# Altium project Gateway-Device-v1.0.PrjPcb (part 3 of 3)
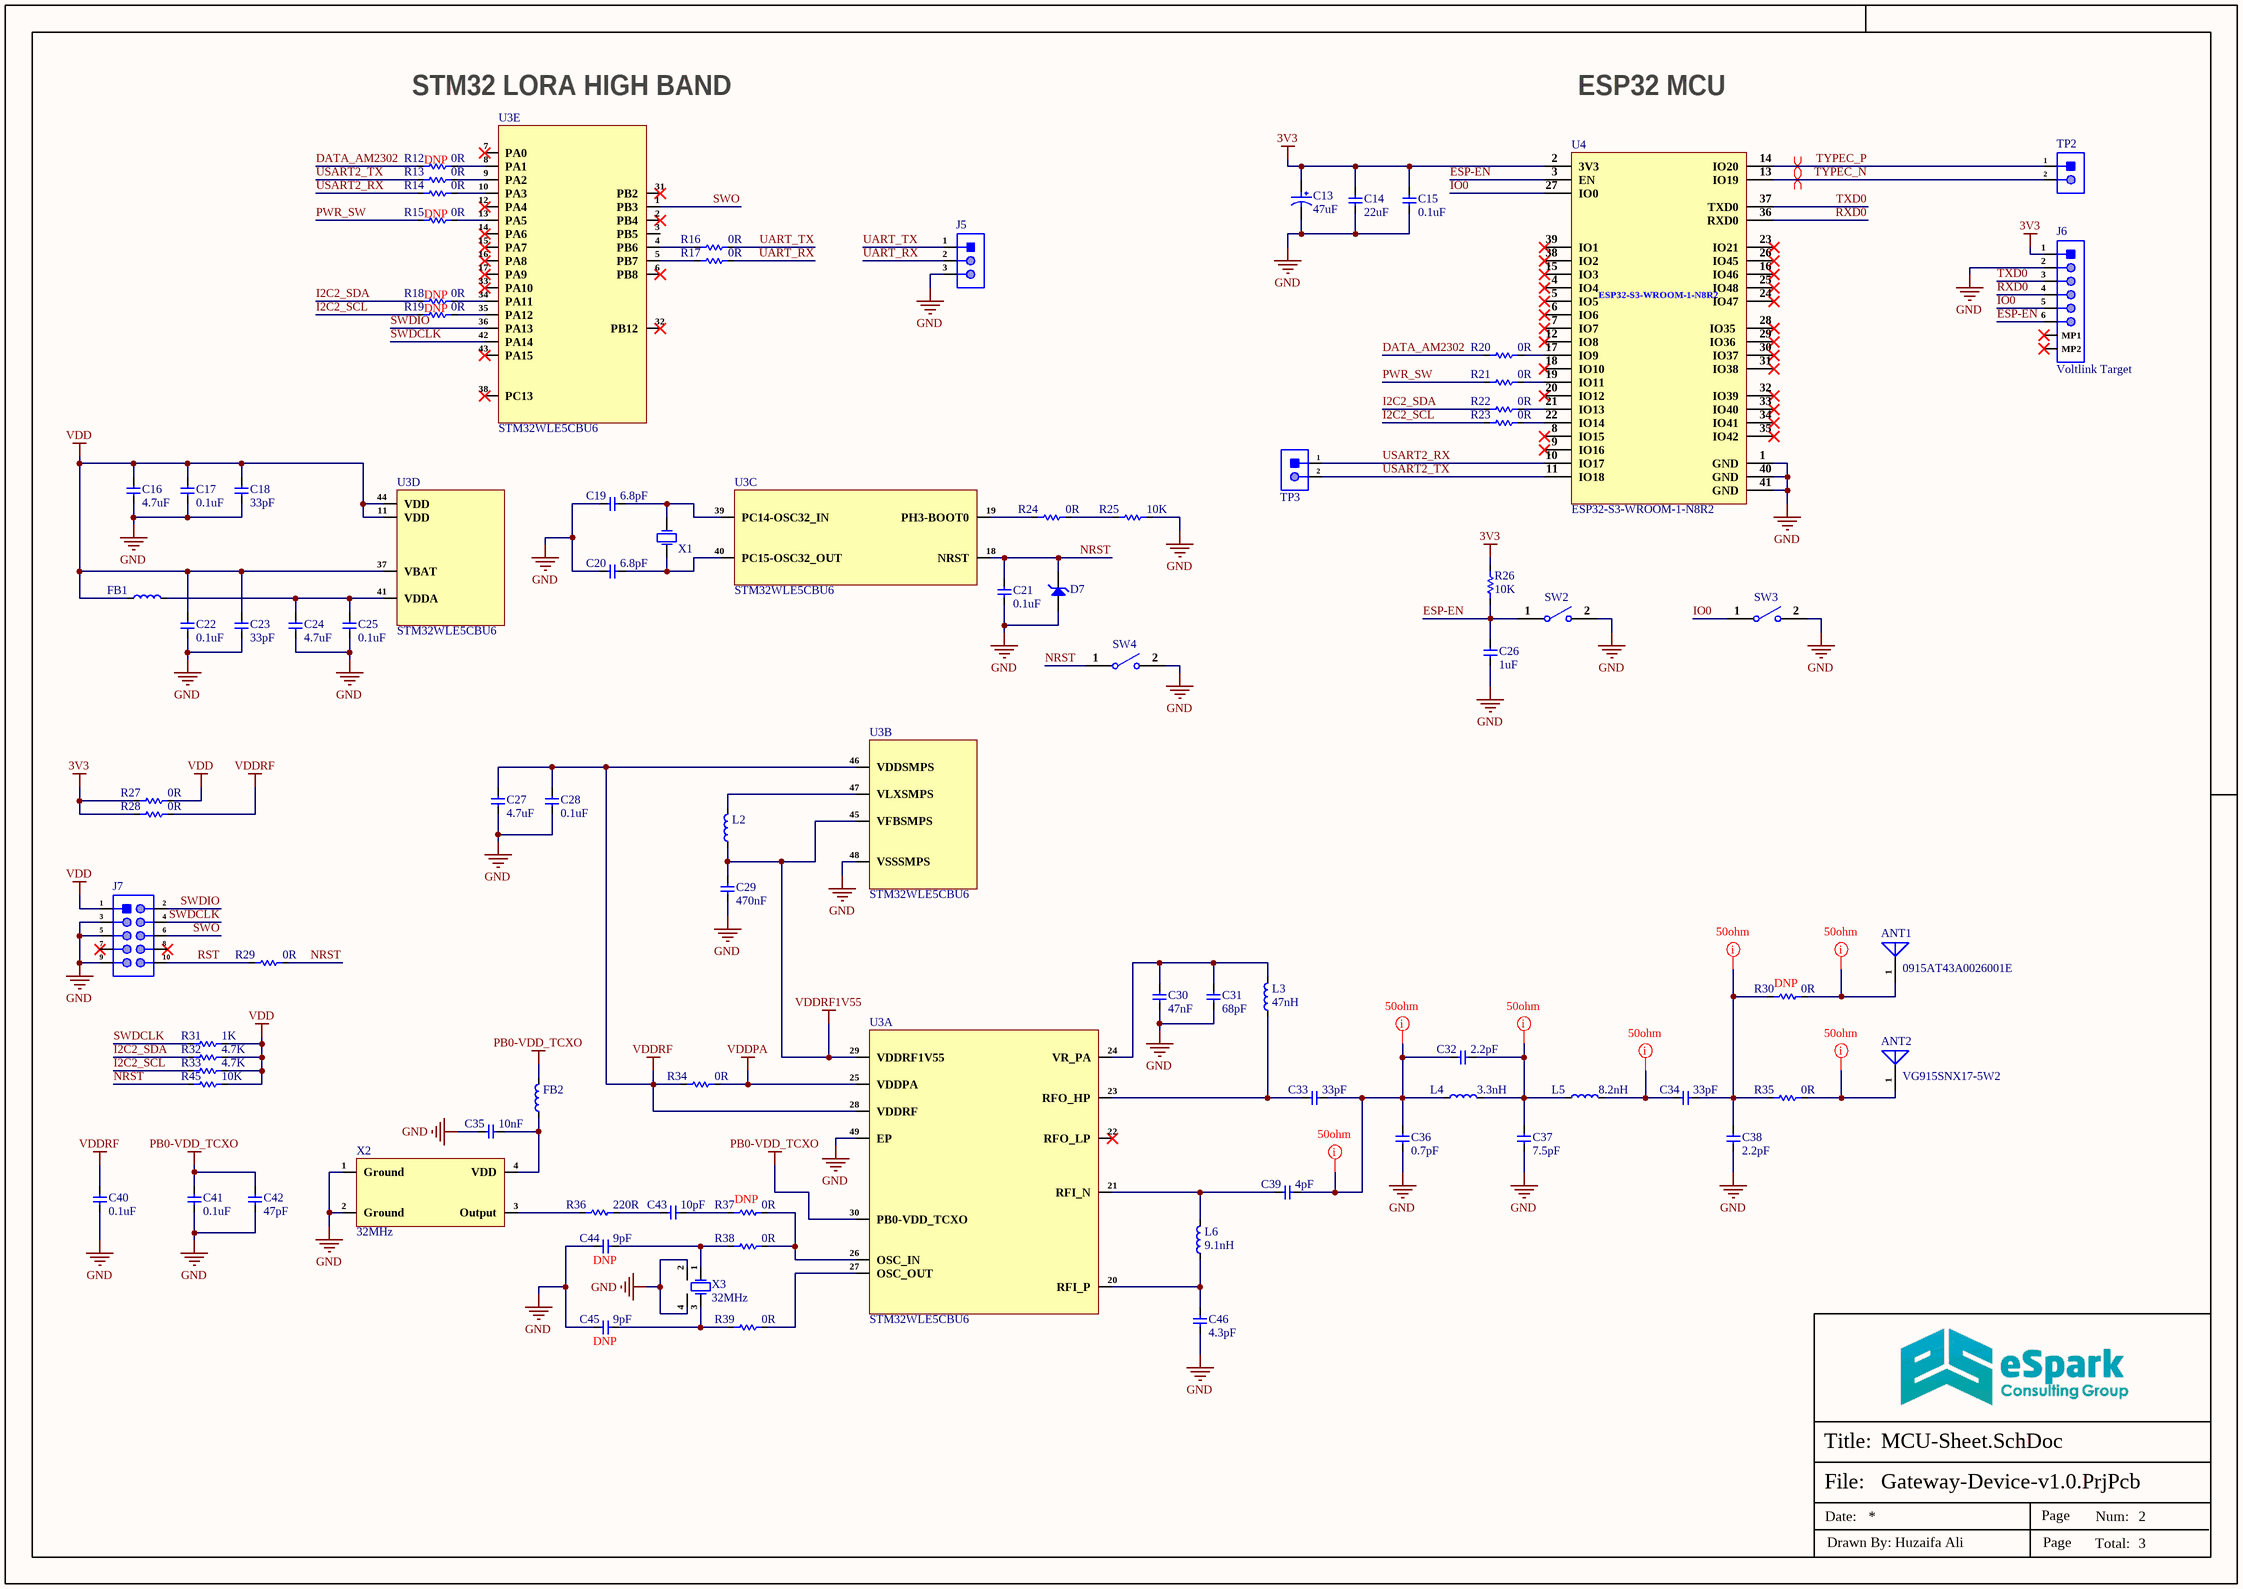
[diagram p4: MCU-Sheet.SchDoc]

## Sheet MCU-Sheet.SchDoc (continued)

### Library data of the parts (continued)
R27 R28 = RC0805FR-070RL: RES 0 OHM JUMPER 1/8W 0805; Manufacturer: Yageo; Resistance: 0mR; Tolerance: 1%; Power Rating: 125mW; Item Type: Resistor; Supplier 1: Avnet; Manufacturer Part Number: RC0805FR-070RL; RoHS: Yes; Category: Chip SMD Resistors; Stock 1: 85000; Pricing 1: 5000=0.00281, 10000=0.00277, 20000=0.00269 (USD); Case/Package: 0805; Contact Plating: Tin,Matte; Case Code (Imperial): 0805; Case Code (Metric): 2012; Size Code: 0805; Min Operating Temperature: -55°C; Max Operating Temperature: 155°C; Resistor Type: Thick Film; Packaging: Tape and Reel; Features: Moisture Resistant; Series: RC; Max Power Dissipation: 125mW; Number of Terminations: 2; Construction: Rectangular; Length: 2mm; Depth: 1.25mm; Radiation Hardening: No; Military Standard: Not; Lead Free: Lead Free; RoHS Compliant: Yes; ComponentLink1URL: https://datasheet.ciiva.com/15189/getdatasheetpartid-348154-15189885.pdf?src-supplier=Verical; ComponentLink1Description: https://datasheet.ciiva.com/15189/getdatasheetpartid-348154-15189885.pdf?src-supplier=Verical; ComponentLink2URL: https://datasheet.ciiva.com/17042/rc0805-17042698.pdf?src-supplier=Future+Electronics; ComponentLink2Description: https://datasheet.ciiva.com/17042/rc0805-17042698.pdf?src-supplier=Future+Electronics; Supplier Part Number 1: RC0805FR-070RL; LCSC Part Number: C100045
R31 = RC0201FR-071KP: RES 1K OHM 1% 1/20W 0201; Manufacturer: Yageo; Supplier 1: Digi-Key; Manufacturer Part Number: RC0201FR-071KP; RoHS: Yes; Stock 1: 4800; Pricing 1: 1=0.11000, 10=0.10200, 100=0.03940, 1000=0.01734, 2500=0.01497, 5000=0.01340 (USD); RoHS Compliant: Yes; Supplier Part Number 1: 13-RC0201FR-071KPCT-ND; LCSC Part Number: C3953443
R32 R33 = RC0402FR-074K7L: RES 4.7K OHM 1% 1/16W 0402; Manufacturer: Yageo; Voltage Rating (DC): 50V; Power Rating: 62.5mW; Resistance: 4.7kR; Temperature Coefficient: 100ppm/°C; Max Power Dissipation: 63mW; Item Type: Resistor; Supplier 1: Avnet; Manufacturer Part Number: RC0402FR-074K7L; RoHS: Yes; Category: Chip SMD Resistors; Stock 1: 2420000; Pricing 1: 10000=0.00085 (USD); Case/Package: 0402; Number of Pins: 2; Case Code (Imperial): 0402; Case Code (Metric): 1005; Size Code: 0402; Min Operating Temperature: -55°C; Max Operating Temperature: 155°C; Tolerance: 1%; Voltage Rating: 50V; Packaging: Tape and Reel; Resistor Type: Thick Film; Termination: SMD/SMT; Features: Moisture Resistant; Series: RC; Number of Terminations: 2; Resistance Tolerance: 1%; Construction: Rectangular; Length: 1mm; Width: 0.5mm; Height: 0.32mm; Depth: 0.5mm; Height - Seated (Max): 0.016inch; RoHS Compliant: Yes; Reach SVHC Compliant: Yes; Military Standard: Not; Lead Free: Lead Free; ComponentLink1URL: https://datasheet.ciiva.com/22661/1686128-22661342.pdf?src-supplier=Element14; ComponentLink1Description: https://datasheet.ciiva.com/22661/1686128-22661342.pdf?src-supplier=Element14; ComponentLink2URL: https://datasheet.ciiva.com/7850/1018594-7850022.pdf?src-supplier=Element14; ComponentLink2Description: https://datasheet.ciiva.com/7850/1018594-7850022.pdf?src-supplier=Element14; ComponentLink3URL: https://datasheet.ciiva.com/7850/1018594-7850023.pdf?src-supplier=Element14; ComponentLink3Description: https://datasheet.ciiva.com/7850/1018594-7850023.pdf?src-supplier=Element14; ComponentLink4URL: https://datasheet.ciiva.com/15215/getdatasheetpartid-328119-15215035.pdf?src-supplier=Verical; ComponentLink4Description: https://datasheet.ciiva.com/15215/getdatasheetpartid-328119-15215035.pdf?src-supplier=Verical; Supplier Part Number 1: RC0402FR-074K7L; LCSC Part Number: C105871
R36 = RC0402FR-07220RL: RES 220 OHM 1% 1/16W 0402; Manufacturer: Yageo; Item Type: Resistors; Power Rating: 62.5mW; Voltage Rating: 50V; Temperature Coefficient: 100ppm/°C; Max Power Dissipation: 63mW; Supplier: Digikey; LCSC Part Number: C112291; Manufacturer Part Number: RC0402FR-07220RL; RoHS: Yes; Stock: 225544; Pricing: 1=0.1, 10=0.007, 100=0.0061, 1000=0.0051, 2500=0.00408 (USD); Case/Package: 0402; Pins: 2; Case Code (Imperial): 0402; Case Code (Metric): 1005; Min Operating Temperature: -55°C; Max Operating Temperature: 155°C; Value: 220R; Tolerance: 1%; Packaging: Tape and Reel; Voltage Rating (DC): 50V; Package Quantity: 1; Termination: SMD/SMT; Resistor Type: Thick Film; Number of Terminations: 2; Features: Moisture Resistant; Series: RC; Resistance Tolerance: 1%; Construction: Rectangular; Technology: THICK FILM; Voltage Rating (AC): 50V; Length: 0.039inch; Width: 0.02inch; Height: 0.016inch; Depth: 0.5mm; Reach SVHC Compliant: No; Military Standard: Not; RoHS Compliant: Yes; Lead Free: 5697LeadFree; ComponentLink1URL: https://datasheet.ciiva.com/2453/pyu-r-int-thick-7-2453461.pdf?src-supplier=Digikey; ComponentLink1Description: https://datasheet.ciiva.com/2453/pyu-r-int-thick-7-2453461.pdf?src-supplier=Digikey
SW2-SW4 = B3U-1000P: SWITCH TACTILE SPST-NO 0.05A 12V; Manufacturer: Omron; Mechanical Life: 200000Cycles; Operating Force: 1.5N; Throw Configuration: SPST; Current Rating: 50mA; Contact Resistance: 100mR; Illumination Type: Non-Illuminated,Illuminated; Switch Travel: 0.15mm; Switch Function: Off-Mom; Actuator Type: Standard; Actuator Length: 0.4mm; Ratings: Dust Proof,IP40; ComponentLink1URL: http://www.farnell.com/datasheets/60838.pdf?src-supplier=Farnell; ComponentLink1Description: http://www.farnell.com/datasheets/60838.pdf?src-supplier=Farnell; ComponentLink2URL: http://www.farnell.com/datasheets/60838.pdf?src-supplier=Element14; ComponentLink2Description: http://www.farnell.com/datasheets/60838.pdf?src-supplier=Element14; ComponentLink3URL: https://omronfs.omron.com/en_US/ecb/products/pdf/en-b3u.pdf?src-supplier=Digi-Key; ComponentLink3Description: https://omronfs.omron.com/en_US/ecb/products/pdf/en-b3u.pdf?src-supplier=Digi-Key; ComponentLink4URL: http://www.omron.com/ecb/products/pdf/en-b3u.pdf?src-supplier=Digi-Key; ComponentLink4Description: http://www.omron.com/ecb/products/pdf/en-b3u.pdf?src-supplier=Digi-Key; ComponentLink5URL: https://www.distrelec.biz/Web/Downloads/he/et/B3U_eng_datasheet.pdf?mime=application%2Fpdf&src-supplier=Distrelec; ComponentLink5Description: https://www.distrelec.biz/Web/Downloads/he/et/B3U_eng_datasheet.pdf?mime=application%2Fpdf&src-supplier=Distrelec; ComponentLink6URL: http://www.onlinecomponents.com/productFiles/mf-OM/en-b3u.pdf?src-supplier=Onlinecomponents.com; ComponentLink6Description: http://www.onlinecomponents.com/productFiles/mf-OM/en-b3u.pdf?src-supplier=Onlinecomponents.com; Supplier 1: Digi-Key; Manufacturer Part Number: B3U-1000P; Stock 1: 116454; Pricing 1: 1=1, 10=0.961, 25=0.9064, 50=0.7976, 100=0.7251, 250=0.68888, 500=0.67074, 1000=0.52571 (USD); Mount: Surface Mount; Weight: 0.000776oz; Contact Material: Silver; Min Operating Temperature: -25°C; Max Operating Temperature: 70°C; Packaging: Tape and Reel; Voltage Rating (DC): 12V; Package Quantity: 1; Max Current Rating: 50mA; Termination: SMD/SMT; Orientation: Straight; Max Voltage Rating (DC): 12V; Electrical Life: 200000Cycles; Insulation Resistance: 100MR; Contact Current Rating: 50mA; Length: 4mm; Height: 1.2mm; Depth: 2.5mm; Width: 3mm; REACH SVHC: Unknown; Lead Free: Lead Free; ComponentLink7URL: https://www.verical.com/server-webapp/html/getDatasheet?partID=552554&src-supplier=Verical; ComponentLink7Description: https://www.verical.com/server-webapp/html/getDatasheet?partID=552554&src-supplier=Verical; ComponentLink8URL: http://www.farnell.com/datasheets/1685550.pdf?src-supplier=Element14; ComponentLink8Description: http://www.farnell.com/datasheets/1685550.pdf?src-supplier=Element14; ComponentLink9URL: http://www.farnell.com/datasheets/2610940.pdf?src-supplier=Farnell; ComponentLink9Description: http://www.farnell.com/datasheets/2610940.pdf?src-supplier=Farnell; ComponentLink10URL: https://www.alliedelec.com/m/d/4c8a9ef82804fc3c241a13c1e298fd73.pdf?src-supplier=Allied+Electronics; ComponentLink10Description: https://www.alliedelec.com/m/d/4c8a9ef82804fc3c241a13c1e298fd73.pdf?src-supplier=Allied+Electronics; Supplier Part Number 1: SW1020DKR-ND; LCSC Part Number: C231329; Item Type: Switch
TP2 TP3 = 2 Test Pad: Wire Connecting Pad; Item Type: Test Point; Manufacturer Part Number: 2 Test Pad
U3 = STM32WLE5CBU6: IC RF TXRX+MCU ISM<1GHZ 48UFQFPN; Manufacturer: STMicroelectronics; Core Architecture: 6081CoreArchitecture; Density: 128KB; Frequency: 48MHz; Max Supply Voltage: 3.6V; Min Supply Voltage: 1.8V; Nominal Supply Current: 31nA; Number of A/D Converters: 1NUMBER; Number of Channels: 12NUMBER; Number of I2C Channels: 3NUMBER; Number of I/Os: 29NUMBER; Number of SPI Channels: 2NUMBER; RAM Size: 48KB; Supplier: Arrow Electronics; LCSC Part Number: C1121847; Manufacturer Part Number: STM32WLE5CBU6; RoHS: No; Item Type: IC; Stock: 1358; Pricing: 1=3.071 (USD); Min Operating Temperature: -40°C; Max Operating Temperature: 85°C; Number of D/A Converters: 1NUMBER; Number of Timers/Counters: 1NUMBER; Number of UART Channels: 1NUMBER
U4 = ESP32-S3-WROOM-1-N8R2: SMD,18x25.5mm WiFi Modules ROHS; Manufacturer: Espressif Systems; Item Type: Module; Supplier 1: Digi-Key; Manufacturer Part Number: ESP32-S3-WROOM-1-N8R2; RoHS: No; Category: Uncategorized; Supplier Part Number 1: 1965-ESP32-S3-WROOM-1-N8R2-ND; ComponentLink1Description: LCSC; ComponentLink1URL: https://www.lcsc.com/product-detail/WiFi-Modules_Espressif-Systems-ESP32-S3-WROOM-1-N8R2_C2913204.html; LCSC Part Number: C2913204
X1 = NX3215SA-32.768K-STD-MUA-14: CRYSTAL 32.7680KHZ 6PF SMD; Manufacturer: NDK; Frequency: 32.768kHz; Frequency Tolerance: 20ppm; ESR (Equivalent Series Resistance): 70kR; Supplier 1: Rs; Manufacturer Part Number: NX3215SA-32.768K-STD-MUA-14; RoHS: Yes; Category: Crystals; Stock 1: 500; Pricing 1: 5=0.15520, 50=0.68600, 100=0.66600, 250=0.65000, 500=0.63400 (GBP); Mounting Technology: Surface Mount; Case/Package: SMD/SMT; Min Operating Temperature: -40°C; Max Operating Temperature: 85°C; Packaging: Cut Tape; Load Capacitance: 6pF; Series: NX3215SA; RoHS Compliant: Yes; ComponentLink1URL: https://datasheet.ciiva.com/6733/c-nx3215sa-std-mua-9-e-6733110.pdf?src-supplier=Digi-Key; ComponentLink1Description: https://datasheet.ciiva.com/6733/c-nx3215sa-std-mua-9-e-6733110.pdf?src-supplier=Digi-Key; ComponentLink2URL: https://datasheet.ciiva.com/6733/c-nx3215sa-std-mua-9-e-6733111.pdf?src-supplier=Digi-Key; ComponentLink2Description: https://datasheet.ciiva.com/6733/c-nx3215sa-std-mua-9-e-6733111.pdf?src-supplier=Digi-Key; ComponentLink3URL: https://datasheet.ciiva.com/6733/c-nx3215sa-std-mua-9-e-6733112.pdf?src-supplier=Digi-Key; ComponentLink3Description: https://datasheet.ciiva.com/6733/c-nx3215sa-std-mua-9-e-6733112.pdf?src-supplier=Digi-Key; Supplier Part Number 1: 1847854; LCSC Part Number: C156244; Item Type: Crystal
X2 = ECS-TXO-25CSMV-320-DY-TR: XTAL OSC TCXO 32.0000MHZ CLPSNW; Manufacturer: ECS International; Item Type: Oscillators; Supplier: Digikey; LCSC Part Number: C2594515; Manufacturer Part Number: ECS-TXO-25CSMV-320-DY-TR; RoHS: Yes; Stock: 17100; Pricing: 1=2, 10=1.739, 50=1.5762, 100=1.5109, 500=1.46514 (USD)
X3 = ECS-320-8-36B-CKY-TR: CRYSTAL 32.0000MHZ 8PF SMD; Manufacturer: ECS International; Supplier: Digikey; LCSC Part Number: C7183282; Manufacturer Part Number: ECS-320-8-36B-CKY-TR; RoHS: Yes; Item Type: Crystal; Stock: 66698; Pricing: 1=0.35, 10=0.301, 50=0.2636, 100=0.2461, 500=0.2369 (USD); ComponentLink1URL: https://ecsxtal.com/store/pdf/ECX-2236B.pdf?src-supplier=Digikey; ComponentLink1Description: https://ecsxtal.com/store/pdf/ECX-2236B.pdf?src-supplier=Digikey

## Sheet Sensor-Sheet.SchDoc
size 420 x 297 mm; SheetNumber: 3; SheetTotal: 3
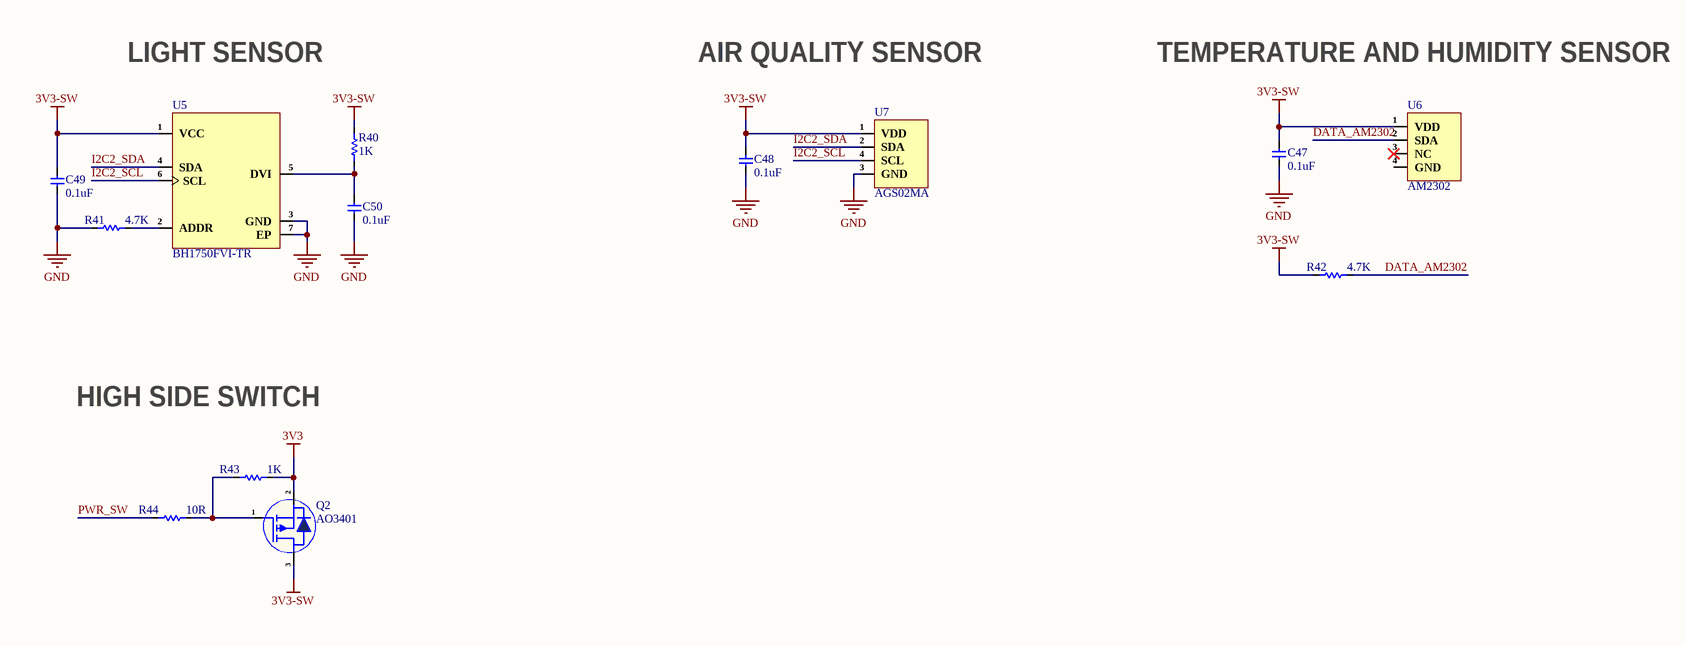
[diagram p2: Sensor-Sheet.SchDoc]

### Parts
C47  0.1uF  [Cap-0402]
C48  0.1uF  [Cap-0402]
C49  0.1uF  [Cap-0402]
C50  0.1uF  [Cap-0402]
Q2  AO3401  [SOT-23]
R40  1K  [Res-0402]
R41  4.7K  [Res-0402]
R42  4.7K  [Res-0402]
R43  1K  [Res-0402]
R44  10R  [Res-0603]
U5  BH1750FVI-TR  [6-WSOF]
U6  AM2302  [AM2302]
U7  AGS02MA  [AGS02MA]

### Nets
3V3: Q2.2(S) R43.1
3V3-SW: C47.2 C48.2 C49.2 Q2.3(D) R40.2 R42.1 U5.1(VCC) U6.1(VDD) U7.1(VDD)
GND: C47.1 C48.1 C49.1 C50.1 R41.1 U5.3(GND) U5.7(EP) U7.3(GND)
DATA_AM2302: R42.2 U6.2(SDA)
I2C2_SCL: U5.6(SCL) U7.4(SCL)
I2C2_SDA: U5.4(SDA) U7.2(SDA)
PWR_SW: R44.1
NetC50_2: C50.2 R40.1 U5.5(DVI)
NetQ2_1: Q2.1(G) R43.2 R44.2
NetR41_2: R41.2 U5.2(ADDR)

Not connected (* = marked no-connect by the designer): U6 3(NC)* 4(GND)

### Notes on the sheet
- LIGHT SENSOR
- AIR QUALITY SENSOR
- TEMPERATURE AND HUMIDITY SENSOR
- HIGH SIDE SWITCH
- File:
- Title:
- Date:
- Page
- Num:
- Total:
- Drawn By: Huzaifa Ali

### Library data of the parts
C47-C50 = CC0402KRX7R8BB104: CAP CER 0.1UF 25V X7R 0402; Manufacturer: Yageo; Tolerance: 10%; Capacitance: 100nF; Dissipation Factor: 3.5%; Supplier 1: Digi-Key; Manufacturer Part Number: CC0402KRX7R8BB104; RoHS: Yes; Category: Ceramic Capacitors; Stock 1: 1841009; Pricing 1: 1=0.10000, 10=0.03100, 50=0.01700, 100=0.01390, 500=0.00990, 1000=0.00777, 2500=0.00707, 5000=0.00650 (USD); Mount: Surface Mount; Case/Package: 0402; Case Code (Imperial): 0402; Case Code (Metric): 1005; Min Operating Temperature: -55°C; Max Operating Temperature: 125°C; Dielectric: X7R; Voltage Rating: 25V; Voltage Rating (DC): 25V; Packaging: Tape and Reel; Termination: SMD/SMT; Resistor Type: Ceramic; Length: 1mm; Width: 0.02inch; Height: 0.5mm; Thickness: 0.022inch; Depth: 0.5mm; Radiation Hardening: No; Lead Free: Lead Free; Halogen Free: Halogen Free; ComponentLink1URL: https://datasheet.ciiva.com/11464/upy-gphc-x7r-6-3v-to-50v-8-11464889.pdf?src-supplier=Avnet; ComponentLink1Description: https://datasheet.ciiva.com/11464/upy-gphc-x7r-6-3v-to-50v-8-11464889.pdf?src-supplier=Avnet; ComponentLink2URL: https://datasheet.ciiva.com/13210/upy-gphc-x7r-6-3v-to-50v-8-12304-13210908.pdf?src-supplier=Mouser; ComponentLink2Description: https://datasheet.ciiva.com/13210/upy-gphc-x7r-6-3v-to-50v-8-12304-13210908.pdf?src-supplier=Mouser; ComponentLink3URL: https://datasheet.ciiva.com/17437/upy-gphc-x7r-6-3v-to-50v-8-17437357.pdf?src-supplier=Avnet+Europe; ComponentLink3Description: https://datasheet.ciiva.com/17437/upy-gphc-x7r-6-3v-to-50v-8-17437357.pdf?src-supplier=Avnet+Europe; Supplier Part Number 1: 311-2077-1-ND; LCSC Part Number: C105883
Q2 = AO3401: Trans Mosfet P-ch 30V 4A 3-PIN SOT-23 T/r; Manufacturer: Alpha & Omega Semiconductor; Manufacturer Part Number: AO3401A; Rds On Max: 44mR; Input Capacitance: 1.2nF; Max Power Dissipation: 1.4W; Number of Elements: 1; Supplier 1: Arrow Electronics; RoHS: Yes; Category: MOSFETs; Mount: Surface Mount; Case/Package: TO-236-3; Number of Pins: 3; Min Operating Temperature: -55°C; Max Operating Temperature: 150°C; Packaging: Tape and Reel; Drain to Source Voltage (Vdss): 30V; Continuous Drain Current (ID): 4A; Power Dissipation: 1.4W; Series: -; Radiation Hardening: No; RoHS Compliant: Yes; Lead Free: Lead Free; ComponentLink1URL: https://datasheet.ciiva.com/940/ao3401a-940720.pdf?src-supplier=Digi-Key; ComponentLink1Description: https://datasheet.ciiva.com/940/ao3401a-940720.pdf?src-supplier=Digi-Key; ComponentLink2URL: https://datasheet.ciiva.com/26927/getdatasheetpartid-79048-26927888.pdf?src-supplier=Verical; ComponentLink2Description: https://datasheet.ciiva.com/26927/getdatasheetpartid-79048-26927888.pdf?src-supplier=Verical; Supplier Part Number 1: AO3401A; LCSC Part Number: C181091; Item Type: Mosfet
R40 R43 = RC0402FR-071KL: RES 1K OHM 1% 1/16W 0402; Manufacturer: Yageo; Resistance: 1kR; Temperature Coefficient: 100ppm/°C; Voltage Rating (DC): 50V; Power Rating: 62.5mW; Max Power Dissipation: 63mW; Item Type: Resistor; Supplier 1: Avnet; Manufacturer Part Number: RC0402FR-071KL; RoHS: Yes; Category: Chip SMD Resistors; Stock 1: 13030000; Pricing 1: 10000=0.00085, 20000=0.00087, 40000=0.00084, 60000=0.00083, 80000=0.00079, 100000=0.00078, 1000000=0.00076 (USD); Case/Package: 0402; Number of Pins: 2; Case Code (Imperial): 0402; Case Code (Metric): 1005; Size Code: 0402; Min Operating Temperature: -55°C; Max Operating Temperature: 155°C; Resistor Type: Thick Film; Tolerance: 1%; Packaging: Tape and Reel; Voltage Rating: 50V; Termination: SMD/SMT; Features: Moisture Resistant; Series: RC; Number of Terminations: 2; Resistance Tolerance: 1%; Construction: Rectangular; Technology: THICK FILM; Length: 1mm; Width: 0.5mm; Height: 0.32mm; Depth: 0.5mm; Reach SVHC Compliant: Yes; Lead Free: Lead Free; RoHS Compliant: Yes; Military Standard: Not; ComponentLink1URL: https://datasheet.ciiva.com/11819/0900766b80c66297-11819477.pdf?src-supplier=RSComponents; ComponentLink1Description: https://datasheet.ciiva.com/11819/0900766b80c66297-11819477.pdf?src-supplier=RSComponents; ComponentLink2URL: https://datasheet.ciiva.com/7983/1018594-7983502.pdf?src-supplier=Element14; ComponentLink2Description: https://datasheet.ciiva.com/7983/1018594-7983502.pdf?src-supplier=Element14; ComponentLink3URL: https://datasheet.ciiva.com/22747/1018594-22747513.pdf?src-supplier=Element14; ComponentLink3Description: https://datasheet.ciiva.com/22747/1018594-22747513.pdf?src-supplier=Element14; ComponentLink4URL: https://datasheet.ciiva.com/12666/pyu-rc0402-51-rohs-l-6-r-12666741.pdf?src-supplier=Mouser; ComponentLink4Description: https://datasheet.ciiva.com/12666/pyu-rc0402-51-rohs-l-6-r-12666741.pdf?src-supplier=Mouser; ComponentLink5URL: https://datasheet.ciiva.com/7849/1018594-7849869.pdf?src-supplier=Element14; ComponentLink5Description: https://datasheet.ciiva.com/7849/1018594-7849869.pdf?src-supplier=Element14; ComponentLink6URL: https://datasheet.ciiva.com/7849/1018594-7849871.pdf?src-supplier=Element14; ComponentLink6Description: https://datasheet.ciiva.com/7849/1018594-7849871.pdf?src-supplier=Element14; ComponentLink7URL: https://datasheet.ciiva.com/17063/pyu-rc0402-51-rohs-l-6-r-17063193.pdf?src-supplier=Future+Electronics; ComponentLink7Description: https://datasheet.ciiva.com/17063/pyu-rc0402-51-rohs-l-6-r-17063193.pdf?src-supplier=Future+Electronics; Supplier Part Number 1: RC0402FR-071KL; LCSC Part Number: C106235
R41 R42 = RC0402FR-074K7L: as R32 on sheet MCU-Sheet; Supplier 1: Avnet; Manufacturer Part Number: RC0402FR-074K7L; RoHS: Yes; Category: Chip SMD Resistors; Stock 1: 2420000; Pricing 1: 10000=0.00085 (USD); Case/Package: 0402; Number of Pins: 2; Case Code (Imperial): 0402; Case Code (Metric): 1005; Size Code: 0402; Min Operating Temperature: -55°C; Max Operating Temperature: 155°C; Tolerance: 1%; Voltage Rating: 50V; Packaging: Tape and Reel; Resistor Type: Thick Film; Termination: SMD/SMT; Features: Moisture Resistant; Series: RC; Number of Terminations: 2; Resistance Tolerance: 1%; Construction: Rectangular; Length: 1mm; Width: 0.5mm; Height: 0.32mm; Depth: 0.5mm; Height - Seated (Max): 0.016inch; RoHS Compliant: Yes; Reach SVHC Compliant: Yes; Military Standard: Not; Lead Free: Lead Free; ComponentLink1URL: https://datasheet.ciiva.com/22661/1686128-22661342.pdf?src-supplier=Element14; ComponentLink1Description: https://datasheet.ciiva.com/22661/1686128-22661342.pdf?src-supplier=Element14; ComponentLink2URL: https://datasheet.ciiva.com/7850/1018594-7850022.pdf?src-supplier=Element14; ComponentLink2Description: https://datasheet.ciiva.com/7850/1018594-7850022.pdf?src-supplier=Element14; ComponentLink3URL: https://datasheet.ciiva.com/7850/1018594-7850023.pdf?src-supplier=Element14; ComponentLink3Description: https://datasheet.ciiva.com/7850/1018594-7850023.pdf?src-supplier=Element14; ComponentLink4URL: https://datasheet.ciiva.com/15215/getdatasheetpartid-328119-15215035.pdf?src-supplier=Verical; ComponentLink4Description: https://datasheet.ciiva.com/15215/getdatasheetpartid-328119-15215035.pdf?src-supplier=Verical; Supplier Part Number 1: RC0402FR-074K7L; LCSC Part Number: C105871
R44 = RC0603FR-0710RL: RES SMD 10 OHM 1% 1/10W 0603; Manufacturer: Yageo; Temperature Coefficient: 200ppm/°C; Power Rating: 100mW; Voltage Rating: 50V; Item type: Resistor; Supplier 1: Digi-Key; Manufacturer Part Number: RC0603FR-0710RL; Stock 1: 10836596; Pricing 1: 1=0.1, 10=0.046, 100=0.0187, 1000=0.0084, 2500=0.00729 (USD); Case/Package: 0603; Number of Pins: 2; Case Code (Imperial): 0603; Case Code (Metric): 1608; Contact Plating: Tin,Matte; Min Operating Temperature: -55°C; Max Operating Temperature: 155°C; Resistance: 10R; Tolerance: 1%; Composition: Thick Film; Packaging: Tape and Reel; Voltage Rating (DC): 50V; Termination: SMD/SMT; Military Standard: Not; Length: 1.6mm; Height: 0.45mm; Width: 0.8mm; Depth: 0.8mm; Radiation Hardening: No; Lead Free: Lead Free; REACH SVHC: No SVHC; ComponentLink1URL: http://www.farnell.com/datasheets/1868787.pdf?src-supplier=Element14; ComponentLink1Description: http://www.farnell.com/datasheets/1868787.pdf?src-supplier=Element14; ComponentLink2URL: http://www.yageo.com/documents/recent/PYu-RC0603_51_RoHS_L_4.pdf?src-supplier=Avnet; ComponentLink2Description: http://www.yageo.com/documents/recent/PYu-RC0603_51_RoHS_L_4.pdf?src-supplier=Avnet; ComponentLink3URL: http://documents.rs-components.com/techlib://itc_doclist_GB.htm?stockno=5048984&src-supplier=RSComponents; ComponentLink3Description: http://documents.rs-components.com/techlib://itc_doclist_GB.htm?stockno=5048984&src-supplier=RSComponents; ComponentLink4URL: http://www.yageo.com/documents/recent/PYu-RC0603_51_RoHS_L_4.pdf?src-supplier=Avnet+Europe; ComponentLink4Description: http://www.yageo.com/documents/recent/PYu-RC0603_51_RoHS_L_4.pdf?src-supplier=Avnet+Europe; Supplier Part Number 1: 311-10.0HRDKR-ND; LCSC Part Number: C109318
U5 = BH1750FVI-TR: SENSOR OPT 560NM AMBIENT 6WSOF; Manufacturer: Rohm; Item Type: IC; Min Supply Voltage: 2.7V; Max Supply Voltage: 3.6V; Interface: I2C,Serial; Max Power Dissipation: 260mW; Output Type: I2C,Digital,DIGITAL OUTPUT; Operating Supply Current: 120uA; Supplier: Digikey; LCSC Part Number: C78960; Manufacturer Part Number: BH1750FVI-TR; RoHS: Yes; Stock: 3772; Pricing: 1=3.29, 5=2.934, 10=2.804, 25=2.648, 50=2.542, 100=2.4447, 500=2.24896, 1000=2.18484 (USD); Mounting Technology: Surface Mount; Case/Package: SMD/SMT; Pins: 6; Contact Plating: Copper,Tin; Min Operating Temperature: -40°C; Max Operating Temperature: 85°C; Packaging: Tape and Reel; Package Quantity: 3000; Type: Integrated Circuit (IC); Wavelength: 560nm; Series: -; Length: 3mm; Width: 1.8mm; Height: 0.75mm; Lead Free: Lead Free; RoHS Compliant: Yes; Reach SVHC Compliant: Unknown; ComponentLink1URL: https://datasheet.ciiva.com/4697/bh1750fvi-e-186247-4697237.pdf?src-supplier=Mouser; ComponentLink1Description: https://datasheet.ciiva.com/4697/bh1750fvi-e-186247-4697237.pdf?src-supplier=Mouser; ComponentLink2URL: https://datasheet.ciiva.com/15098/getdatasheetpartid-451213-15098956.pdf?src-supplier=Verical; ComponentLink2Description: https://datasheet.ciiva.com/15098/getdatasheetpartid-451213-15098956.pdf?src-supplier=Verical; ComponentLink3URL: https://datasheet.ciiva.com/2819/bh1750fvi-e-2819308.pdf?src-supplier=Digikey; ComponentLink3Description: https://datasheet.ciiva.com/2819/bh1750fvi-e-2819308.pdf?src-supplier=Digikey; ComponentLink4URL: https://datasheet.ciiva.com/2819/bh1750fvi-e-2819309.pdf?src-supplier=Digikey; ComponentLink4Description: https://datasheet.ciiva.com/2819/bh1750fvi-e-2819309.pdf?src-supplier=Digikey; ComponentLink5URL: https://datasheet.ciiva.com/2819/bh1750fvi-e-2819310.pdf?src-supplier=Digikey; ComponentLink5Description: https://datasheet.ciiva.com/2819/bh1750fvi-e-2819310.pdf?src-supplier=Digikey
U6 = AM2302: SIP-4 Temperature and Humidity Sensor ROHS; Manufacturer: Aosong (Guangzhou) Elec; Manufacturer Part Number: AM2302; Package: SIP-4; LCSC Part Number: C83988; Item Type: Sensor; ComponentLink1Description: LCSC; ComponentLink1URL: https://lcsc.com/product-detail/Temperature-and-Humidity-Sensor_Aosong-Guangzhou-Elec-AM2302_C83988.html?s_z=n_am2302
U7 = AGS02MA: SIP-4 Gas Sensors ROHS; Manufacturer: Aosong (Guangzhou) Elec; Item Type: Sensor; Manufacturer Part Number: AGS02MA; Package: SIP-4; LCSC Part Number: C3012633; ComponentLink1Description: LCSC; ComponentLink1URL: https://lcsc.com/product-detail/Gas-Sensors_Aosong-Guangzhou-Elec-AGS02MA_C3012633.html?s_z=n_AGS02MA%2520

## Nets that join several sheets
3V3: Power-Sheet (6 pins), MCU-Sheet (8 pins), Sensor-Sheet (Q2.2 R43.1)
GND: Power-Sheet (40 pins), MCU-Sheet (48 pins), Sensor-Sheet (8 pins)
DATA_AM2302: MCU-Sheet (R12.1 R20.1), Sensor-Sheet (R42.2 U6.2)
I2C2_SCL: MCU-Sheet (R19.1 R23.1 R33.1), Sensor-Sheet (U5.6 U7.4)
I2C2_SDA: MCU-Sheet (R18.1 R22.1 R32.1), Sensor-Sheet (U5.4 U7.2)
PWR_SW: MCU-Sheet (R15.1 R21.1), Sensor-Sheet (R44.1)